# Altium project QCM_hardware_V2.PrjPcb
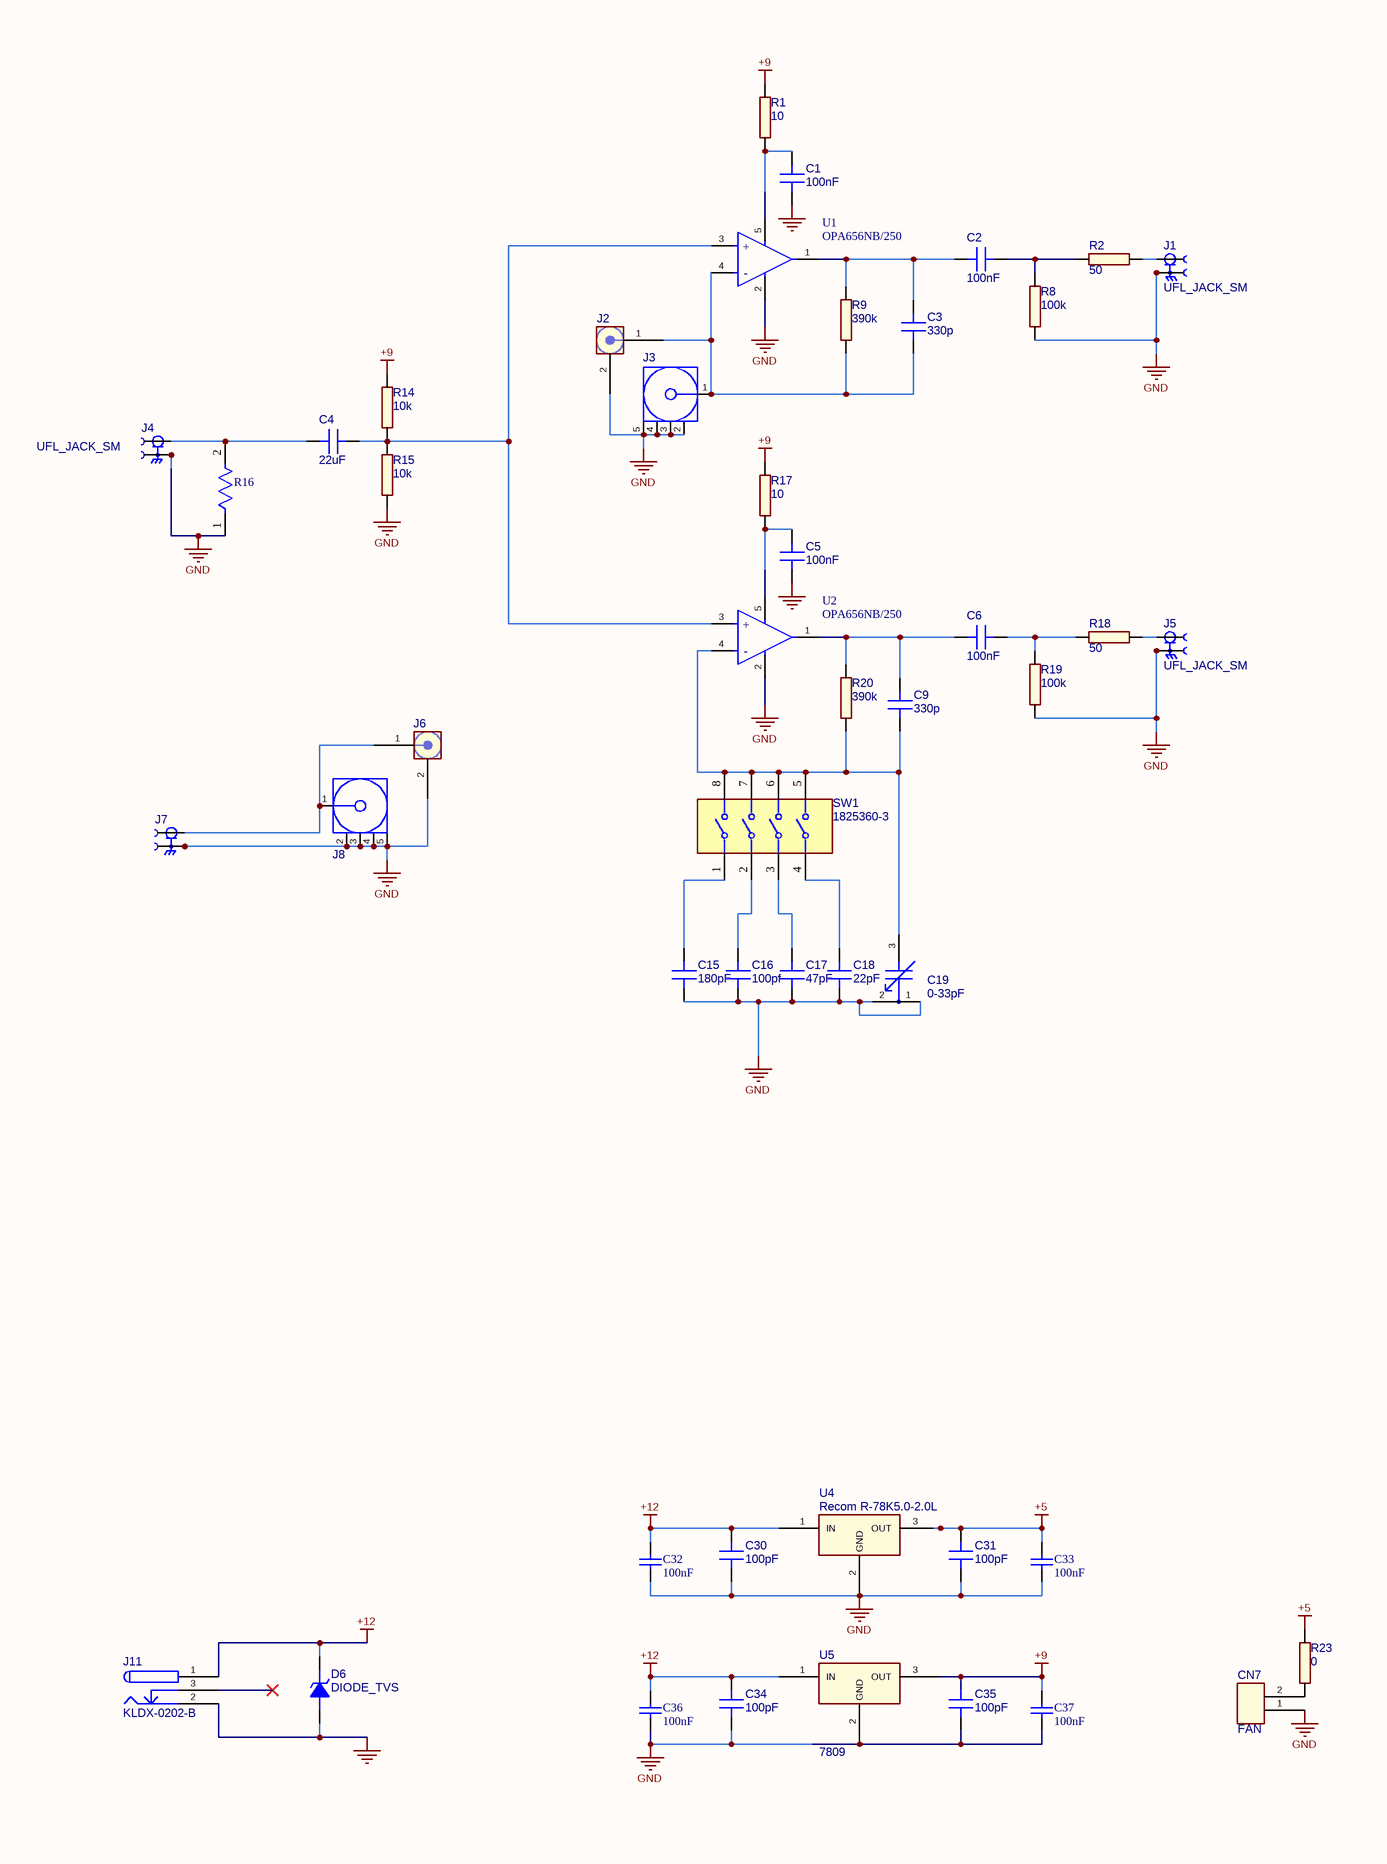
[diagram p0: QCM_hardware_V2.SchDoc, left]
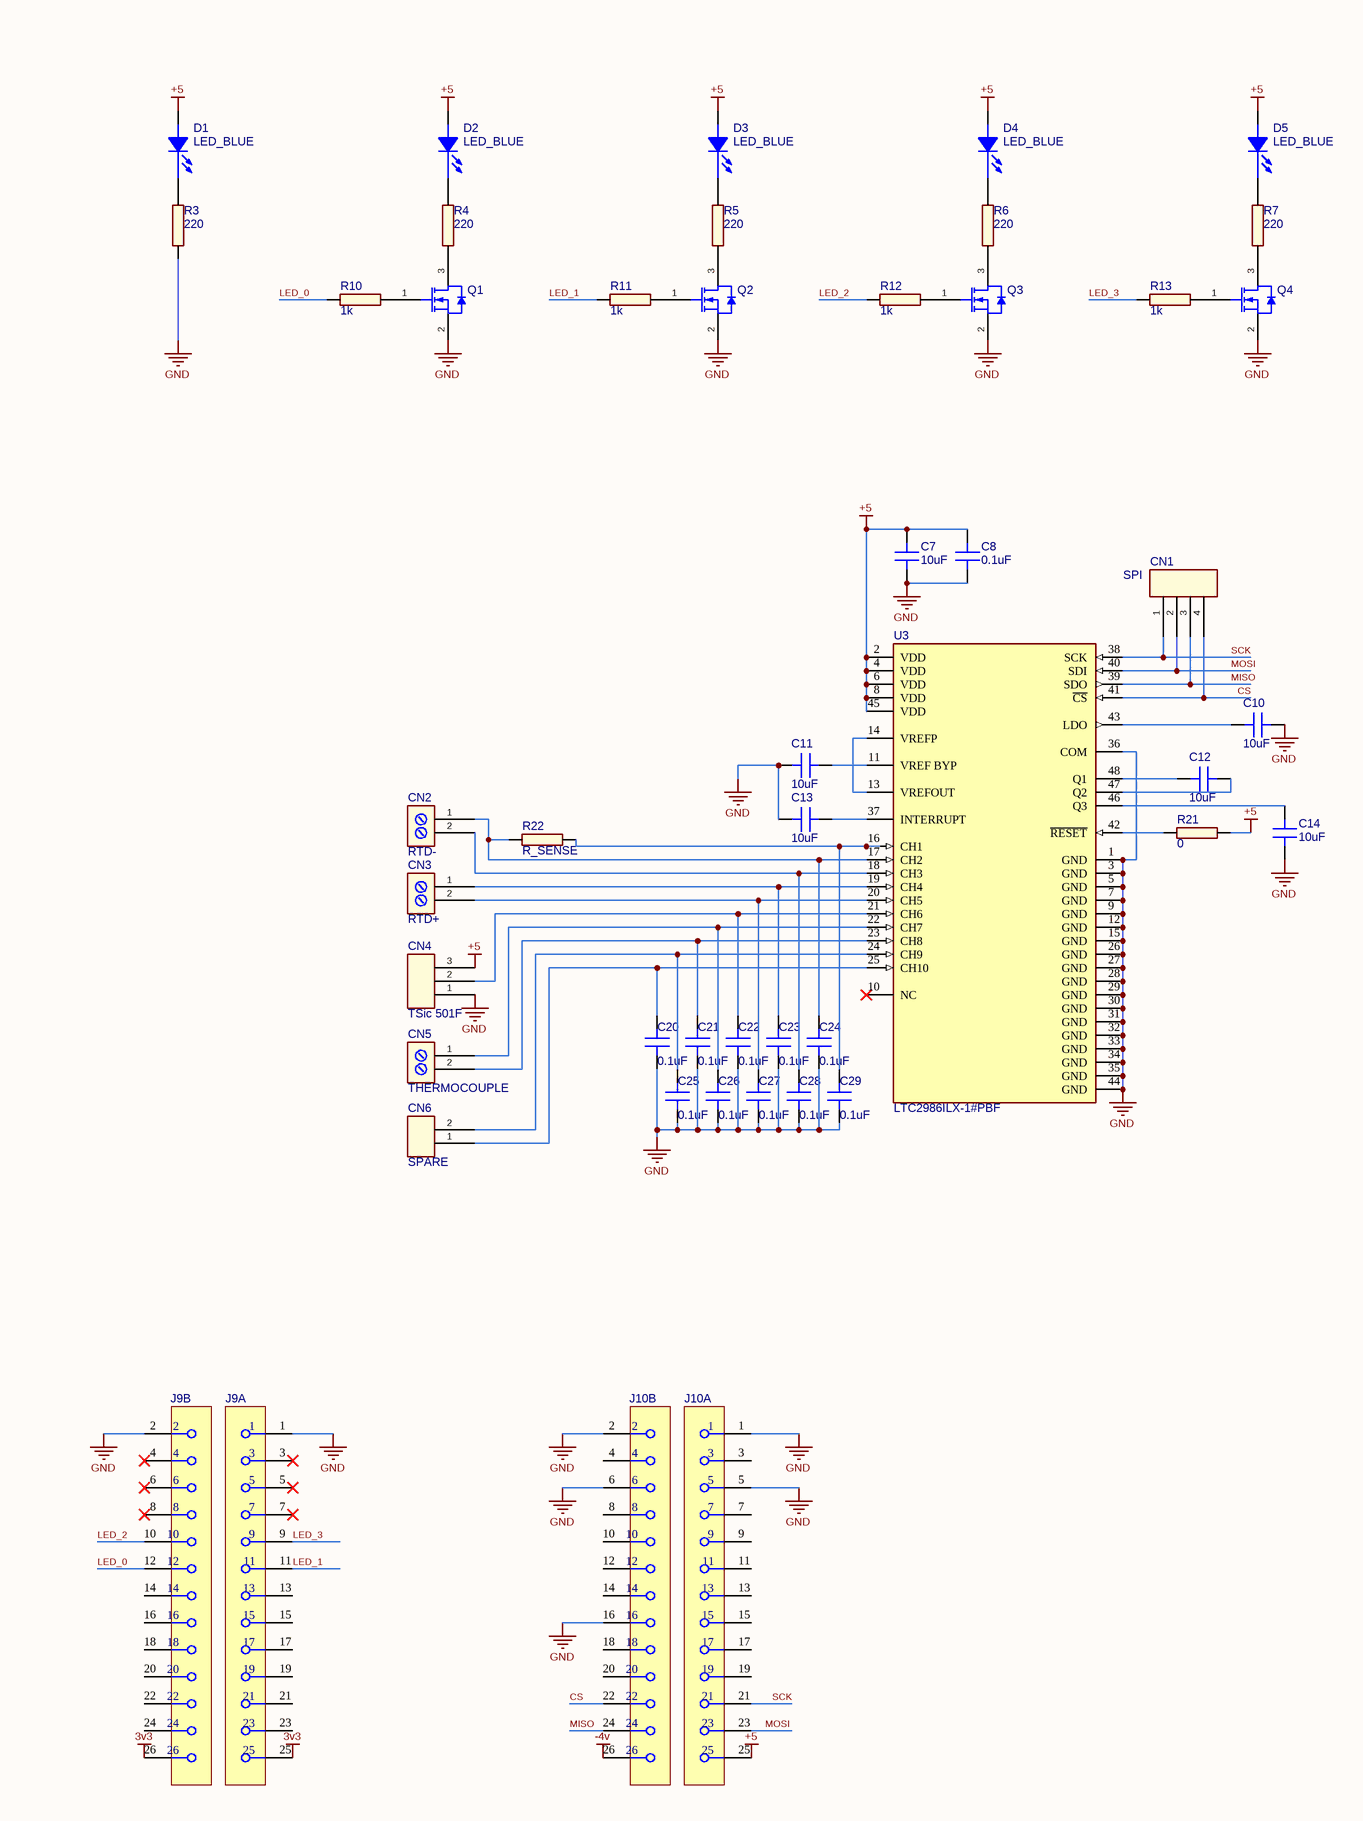
[diagram p1: QCM_hardware_V2.SchDoc, right]
1 sheet, 95 parts. Net scope: global (net labels, ports and power ports of the same name join across sheets).
Board file: QCM_hardware_V2.PcbDoc

## Sheet QCM_hardware_V2.SchDoc
size A2; SheetNumber: 1; SheetTotal: 1

### Parts
?  (no value)  (graphical)
C1  100nF  [C_0805]
C2  100nF  [C_0805]
C3  330p  [C_0805]
C4  22uF  [C_0805]
C5  100nF  [C_0805]
C6  100nF  [C_0805]
C7  10uF  [C_0805]
C8  0.1uF  [C_0805]
C9  330p  [C_0805]
C10  10uF  [C_0805]
C11  10uF  [C_0805]
C12  10uF  [C_0805]
C13  10uF  [C_0805]
C14  10uF  [C_0805]
C15  180pF  [C_0805]
C16  100pf  [C_0805]
C17  47pF  [C_0805]
C18  22pF  [C_0805]
C19  0-33pF  [FP-BFC280832659-MFG]
C20  0.1uF  [C_0805]
C21  0.1uF  [C_0805]
C22  0.1uF  [C_0805]
C23  0.1uF  [C_0805]
C24  0.1uF  [C_0805]
C25  0.1uF  [C_0805]
C26  0.1uF  [C_0805]
C27  0.1uF  [C_0805]
C28  0.1uF  [C_0805]
C29  0.1uF  [C_0805]
C30  100pF  [C_0805]
C31  100pF  [C_0805]
C32  100nF  [CAPC1206(3216)170_N]
C33  100nF  [CAPC1206(3216)170_N]
C34  100pF  [C_0805]
C35  100pF  [C_0805]
C36  100nF  [CAPC1206(3216)170_N]
C37  100nF  [CAPC1206(3216)170_N]
CN1  SPI  [HDR4]
CN2  RTD-  [TERMINAL_BLOCK2]
CN3  RTD+  [TERMINAL_BLOCK2]
CN4  TSic 501F  [HDR3]
CN5  THERMOCOUPLE  [TERMINAL_BLOCK2]
CN6  SPARE  [HDR2]
CN7  FAN  [HDR2]
D1  LED_BLUE  [LED_3MM_BLUE]
D2  LED_BLUE  [LED_3MM_BLUE]
D3  LED_BLUE  [LED_3MM_BLUE]
D4  LED_BLUE  [LED_3MM_BLUE]
D5  LED_BLUE  [LED_3MM_BLUE]
D6  DIODE_TVS  [DIODE_SMA]
J1  UFL_JACK_SM  [UFL_JACK_SM]
J2  BNC_ELBOW2  [BNC_ELBOW2]  (value not drawn)
J3  60711002241505  [60711002241505]  (value not drawn)
J4  UFL_JACK_SM  [UFL_JACK_SM]
J5  UFL_JACK_SM  [UFL_JACK_SM]
J6  BNC_ELBOW2  [BNC_ELBOW2]  (value not drawn)
J7  UFL_JACK_SM  [UFL_JACK_SM]  (value not drawn)
J8  60711002241505  [60711002241505]  (value not drawn)
J9  SFH11-PBPC-D13-ST-BK  [SFH11-PBPC-D13-ST-BK_MFG]  (value not drawn)  (parts A,B of 2)
J10  SFH11-PBPC-D13-ST-BK  [SFH11-PBPC-D13-ST-BK_MFG]  (value not drawn)  (parts A,B of 2)
J11  KLDX-0202-B  [KYCN-KLDX-0202-B_V]
Q1  2N7002K  [ONSC-SOT-23-3-318-08_V]  (value not drawn)
Q2  2N7002K  [ONSC-SOT-23-3-318-08_V]  (value not drawn)
Q3  2N7002K  [ONSC-SOT-23-3-318-08_V]  (value not drawn)
Q4  2N7002K  [ONSC-SOT-23-3-318-08_V]  (value not drawn)
R1  10  [R_0805]
R2  50  [R_0805]
R3  220  [R_0805]
R4  220  [R_0805]
R5  220  [R_0805]
R6  220  [R_0805]
R7  220  [R_0805]
R8  100k  [R_0805]
R9  390k  [R_0805]
R10  1k  [R_0805]
R11  1k  [R_0805]
R12  1k  [R_0805]
R13  1k  [R_0805]
R14  10k  [R_0805]
R15  10k  [R_0805]
R16  CRCW080550R0FKTA  [FP-D12-CRCW0805-MFG]  (value not drawn)
R17  10  [R_0805]
R18  50  [R_0805]
R19  100k  [R_0805]
R20  390k  [R_0805]
R21  0  [R_0805]
R22  R_SENSE  [R_AXIAL_9.0x3.2mm_p12.7mm]
R23  0  [R_0805]
SW1  1825360-3  [FP-1825360-3-MFG]
U1  OPA656NB/250  [FP-DBV0005A-IPC_A]
U2  OPA656NB/250  [FP-DBV0005A-IPC_A]
U3  LTC2986ILX-1#PBF  [FP-LX-48-05-08-1760-MFG]
U4  Recom R-78K5.0-2.0L  [TO220H]
U5  7809  [TO220H]

### Nets
3v3: J9.25 J9.26
+5: C7.1 C8.1 C31.2 C33.2 CN4.3 D1.A(ANODE) D2.A(ANODE) D3.A(ANODE) D4.A(ANODE) D5.A(ANODE) J10.25 R21.1 R23.2 U3.2(VDD) U3.4(VDD) U3.6(VDD) U3.8(VDD) U3.45(VDD) U4.3(OUT)
+9: C35.2 C37.2 R1.1 R14.1 R17.1 U5.3(OUT)
+12: C30.2 C32.2 C34.2 C36.2 D6.C(CATHODE) J11.1 U4.1(IN) U5.1(IN)
-4v: J10.26
GND: C1.2 C5.2 C7.2 C8.2 C10.2 C11.1 C13.1 C14.2 C15.2 C16.2 C17.2 C18.2 C19.1(R) C19.2(R) C20.2 C21.2 C22.2 C23.2 C24.2 C25.2 C26.2 C27.2 C28.2 C29.2 C30.1 C31.1 C32.1 C33.1 C34.1 C35.1 C36.1 C37.1 CN4.1 CN7.1 D6.A(ANODE) J1.2 J1.3 J2.2(SHIELD) J3.2(GND) J3.3(GND) J3.4(GND) J3.5(GND) J4.2 J4.3 J5.2 J5.3 J6.2(SHIELD) J7.2 J7.3 J8.2(GND) J8.3(GND) J8.4(GND) J8.5(GND) J9.1 J9.2 J10.1 J10.2 J10.5 J10.6 J10.16 J11.2 Q1.2(S) Q2.2(S) Q3.2(S) Q4.2(S) R3.2 R8.2 R15.2 R16.1 R19.2 U1.2(-VS) U2.2(-VS) U3.1(GND) U3.3(GND) U3.5(GND) U3.7(GND) U3.9(GND) U3.12(GND) U3.15(GND) U3.26(GND) U3.27(GND) U3.28(GND) U3.29(GND) U3.30(GND) U3.31(GND) U3.32(GND) U3.33(GND) U3.34(GND) U3.35(GND) U3.36(COM) U3.44(GND) U4.2(GND) U5.2(GND)
CS: CN1.4 J10.22 U3.41(~{CS})
LED_0: J9.12 R10.1
LED_1: J9.11 R11.1
LED_2: J9.10 R12.1
LED_3: J9.9 R13.1
MISO: CN1.3 J10.24 U3.39(SDO)
MOSI: CN1.2 J10.23 U3.40(SDI)
SCK: CN1.1 J10.21 U3.38(SCK)
NetC1_1: C1.1 R1.2 U1.5(+VS)
NetC2_1: C2.1 C3.1 R9.2 U1.1(VOUT)
NetC2_2: C2.2 R2.1 R8.1
NetC3_2: C3.2 J2.1(CENTER) J3.1(Signal) R9.1 U1.4(VIN-)
NetC4_1: C4.1 J4.1 R16.2
NetC4_2: C4.2 R14.2 R15.1 U1.3(VIN+) U2.3(VIN+)
NetC5_1: C5.1 R17.2 U2.5(+VS)
NetC6_1: C6.1 C9.1 R20.2 U2.1(VOUT)
NetC6_2: C6.2 R18.1 R19.1
NetC9_2: C9.2 C19.3(S) R20.1 SW1.5 SW1.6 SW1.7 SW1.8 U2.4(VIN-)
NetC10_1: C10.1 U3.43(LDO)
NetC11_2: C11.2 U3.11(VREF_BYP)
NetC12_1: C12.1 U3.48(Q1)
NetC12_2: C12.2 U3.47(Q2)
NetC13_2: C13.2 U3.37(INTERRUPT)
NetC14_1: C14.1 U3.46(Q3)
NetC15_1: C15.1 SW1.1
NetC16_1: C16.1 SW1.2
NetC17_1: C17.1 SW1.3
NetC18_1: C18.1 SW1.4
NetC20_1: C20.1 CN6.1 U3.25(CH10)
NetC21_1: C21.1 CN5.2 U3.23(CH8)
NetC22_1: C22.1 CN4.2 U3.21(CH6)
NetC23_1: C23.1 CN3.1 U3.19(CH4)
NetC24_1: C24.1 CN2.1 R22.1 U3.17(CH2)
NetC25_1: C25.1 CN6.2 U3.24(CH9)
NetC26_1: C26.1 CN5.1 U3.22(CH7)
NetC27_1: C27.1 CN3.2 U3.20(CH5)
NetC28_1: C28.1 CN2.2 U3.18(CH3)
NetC29_1: C29.1 R22.2 U3.16(CH1)
NetCN7_2: CN7.2 R23.1
NetD1_C: D1.C(CATHODE) R3.1
NetD2_C: D2.C(CATHODE) R4.1
NetD3_C: D3.C(CATHODE) R5.1
NetD4_C: D4.C(CATHODE) R6.1
NetD5_C: D5.C(CATHODE) R7.1
NetJ1_1: J1.1 R2.2
NetJ5_1: J5.1 R18.2
NetJ6_1: J6.1(CENTER) J7.1 J8.1(Signal)
NetQ1_1: Q1.1(G) R10.2
NetQ1_3: Q1.3(D) R4.2
NetQ2_1: Q2.1(G) R11.2
NetQ2_3: Q2.3(D) R5.2
NetQ3_1: Q3.1(G) R12.2
NetQ3_3: Q3.3(D) R6.2
NetQ4_1: Q4.1(G) R13.2
NetQ4_3: Q4.3(D) R7.2
NetR21_2: R21.2 U3.42(~{RESET})
NetU3_13: U3.13(VREFOUT) U3.14(VREFP)

Not connected (* = marked no-connect by the designer): J9 3* 4* 5* 6* 7* 8* 13 14 15 16 17 18 19 20 21 22 23 24; J10 3 4 7 8 9 10 11 12 13 14 15 17 18 19 20; J11 3*; U3 10(NC)*

### Notes on the sheet
- Date:
- ELD/LION, Leiden University
- File:
- Engineer:
- Sheet:
- of
- Revision:
- (in symbol CMP-0018-00414-3) +; -

### Library data of the parts
? = TitleBlock-ELD
C1-C18 C20-C31 C34 C35 = C_0805
C19 = CMP-02422-000001-1: CAP TRIMMER 5.5-65PF 150V TH; Manufacturer: Vishay BC Components; Manufacturer Part Number: BFC280832659; Temperature Coefficient: +300/-700ppm/°C; Material: Polypropylene; Category: Cap; Voltage Rating: 150V; Octopart: https://octopart.com/bfc280832659-vishay-41937824; Device Class L2: Capacitors; Device Class L1: Passive Components; Value: 5.5-65pF; Temperature Range Low: -40°C; Capacitance: 5.5-65pF; ComponentLink2URL: https://www.vishay.com/docs/28528/bfc2808-10mm.pdf; Temperature: -40°C to +70°C; ComponentLink2Description: Datasheet; Temperature Range High: +70°C; Device Class L3: Trimmer / Variable Capacitors; RoHS: TRUE; Lead Free: Yes; Digikey Description: CAP TRIMMER 5.5-65PF 150V TH; Automotive: No; Package: BFC280832659; Mouser Description: Trimmer / Variable Capacitors TRIMMER CAPACITOR; Height: 11mm
C32 C33 C36 C37 = CMP-1037-04098-1: CAP 68nF 100V ±5% 1206 (3216 Metric) Thickness 1.7mm SMD; Case-Metric: 3216; Case-EIA: 1206; Tolerance: Â±5%; Technology: SMT; Value: 68nF; Max Thickness: 1.7 mm; Rated Voltage: 100 V
CN1 = HDR4
CN2 CN3 CN5 = TERMINAL_BLOCK2
CN4 = HDR3
CN6 CN7 = HDR2
J1 J4 J5 J7 = UFL_JACK_SM: U.FL (UMCC) Connector Jack, Male Pin 50Ohm Surface Mount Solder; MP: CONUFL001-SMD-T; MF: Linx; Price: None; Package: None; Value: *; Check_prices: https://www.snapeda.com/parts/CONUFL001-SMD-T/Linx/view-part/?ref=eda; Availability: Unavailable; SnapEDA_Link: https://www.snapeda.com/parts/CONUFL001-SMD-T/Linx/view-part/?ref=snap
J3 J8 = CMP-03913-162524349-1: Rf Conn, Bnc, R/a Jack, 50 Ohm, Tht Rohs Compliant: Yes
J9 J10 = CMP-00595-18674420-1: Conn Socket Strip F 26 POS 2.54mm Solder ST Thru-Hole; Current Rating: 3A; Number of Positions: 26; Connector Type: Header, Socket; Contact Resistance: 20mΩ; Insulation Resistance: 1GΩ; Min Operating Temperature: -40°C; Lead Free: Lead Free; Contact Plating: Gold; HelpURL: https://drawings-pdf.s3.amazonaws.com/11160.pdf; Termination: Solder; Max Operating Temperature: 105°C; ComponentLink2Description: Datasheet URL; Pitch: 2.54mm; RoHS: Compliant; Number of Pins: 26; Mount: Through Hole; Terminal Pitch: 2.54mm; Row Spacing: 2.54mm; Number of Rows: 2; ComponentLink2URL: https://drawings-pdf.s3.amazonaws.com/11160.pdf; REACH SVHC: Yes; Introduction Date: 2011-09-15; Contact Gender: Female; Lifecycle Status: Production; Color: Black
J11 = CMP-0256-00001-1: 3 Conductor Power Jack, 2 break 2 aux contacts; ComponentLink2URL: http://anacapa.kycon.com/Catalog_PDF/KLDX_0202.pdf; PackageReference: KLDX-0202-B; Contact Finish: Brass; ComponentLink2Description: Datasheet; Mounting Technology: Through Hole; PackageDescription: Jack, 9 x 14.5 mm Body, 2.5 mm Center Pin Diameter; ComponentLink1Description: Manufacturer URL; PartNumber: KLDX-0202-B; ComponentLink1URL: http://kycon.com/
Q1-Q4 = CMP-1058-00778-1: N-Channel TrenchFET Power MOSFET, 300 mA, 60 V Enhancement, 3-Pin SOT-23 2N7002K-T1-GE3; PartNumber: MGSF1N03LT1G; Manufacturer: On Semiconductor; VGS(th) Max (V): 2.4; Channel Polarity: N Channel; Ciss Typ (pF): 140; Packing: Tape and Reel; Crss Typ (pF): 40; Coss Typ (pF): 100; Configuration: Single; V(BR)DSS Min (V): 30; ID Max (A): 2.1; VGS Max (V): 20; ComponentLink1Description: Manufacturer URL; DatasheetVersion: Rev. 10; ComponentLink1URL: http://www.onsemi.com/; Mounting Technology: Surface Mount; PackageVersion: Rev. AP, 11/2009; PackageDescription: 3-Pin Small Outline Transistor, Body 2.92 x 1.3 mm, Pitch 0.95 mm; Package Type: SOT-23-3; ComponentLink3URL: http://www.onsemi.cn/pub_link/Collateral/318-08.PDF; RoHS: Pb-Free; ComponentLink3Description: Package Specification; ComponentLink2Description: Datasheet; PackageReference: SOT-23-3-318-08; ComponentLink2URL: http://www.onsemi.cn/pub_link/Collateral/MGSF1N03LT1-D.PDF
R1-R15 R17-R21 R23 = R_0805
R16 = CMP-00030-21390498-1: CRCW080550R0FKTA Res Thick Film 0805 50 Ohm 1% 0.125W(1/8W) ±100ppm/C Pad SMD Automotive T/R; Temperature Coefficient: 100ppm/°C; Resistance: 50Ω; Voltage Rating: 150V; Power Rating: 125mW; Length: 2mm; Case Code (Imperial): 0805; Height: 450µm; Contact Plating: Lead, Tin; Width: 1.25mm; Max Operating Temperature: 155°C; NexarPartId: 21390498; Case Code (Metric): 2012; Min Operating Temperature: -55°C; Tolerance: 1%; Case/Package: 0805; Lead Free: Contains Lead; RoHS: Non-Compliant; Composition: Thick Film; Weight: 5.499807mg
R22 = R_1W: Throughhole resistor with a 12.7mm pitch (Standard 1W metalfilm/carbon)
SW1 = CMP-03400-000022-1: SWITCH SLIDE DIP SPST 100MA 24V; Washable: Yes; Contact Current Rating: 1A; Electrical Life: 1000Cycles; Number of Circuits: 4; Pitch: 0.1inch; Actuator Length: 0.99mm; Contact Resistance: 50mR; Actuator Type: Standard; Contact Post Length: 4mm; Voltage Rating (DC): 5V; Actuator Material: Polybutylene; Sealable: No (Without); Max Voltage Rating (DC): 24V; Throw Configuration: SPST; Mount: Through Hole; Type: Switch; RoHS Compliant: Yes; Min Operating Temperature: -30°C; Max Operating Temperature: 85°C; Orientation: Straight; Packaging: Rail/Tube; Series: ADE; Lead Free: Lead Free; Depth: 7.49mm; Flammability Rating: UL94 V-0; Radiation Hardening: No; Terminal Pitch: 2.54mm; Package Quantity: 35; Contact Material: Copper Alloy; Housing Color: Black; Number of Positions: 4; Length: 0.476inch; ELV: Compliant; Termination: PC Pins; Housing Material: Polyphenylene; Contact Plating: Gold; Max Current Rating: 100mA; Height: 0.138inch
U1 U2 = CMP-0018-00414-3: IC OPAMP VFB 1 CIRCUIT SOT23-5; Number of Elements: 1; Max Dual Supply Voltage: 6V; Input Bias Current: 20pA; Slew Rate: 290V/µs; Power Supply Rejection Ratio (PSRR): 74dB; Common Mode Rejection Ratio: 88dB; Operating Supply Voltage: 12V; Settling Time: 16ns; Dual Supply Voltage: 5V; Unity Gain Bandwidth Product: 230MHz; Nominal Supply Current: 16mA; Min Supply Voltage: 10V; Input Offset Voltage (Vos): 600uV; Packaging: Tape and Reel; Lead Free: Lead Free; Max Operating Temperature: 85°C; Width: 1.6mm; Min Operating Temperature: -40°C; Number of Circuits: 1; Package Quantity: 250; Number of Pins: 5; Case/Package: SOT-23; Height: 1.15mm; Max Supply Voltage: 12V; Number of Channels: 1; Length: 2.9mm; Number of Amplifiers: 1; Max I/O Voltage: 600uV; Bandwidth: 230MHz; REACH SVHC: No SVHC; Radiation Hardening: No; Gain Bandwidth Product: 230MHz
U3 = CMP-09131-000069-1: IC SENSOR TEMP MEASUREMNT 48LQFP; Max Supply Voltage: 5.25V; Min Supply Voltage: 2.85V; Number of Pins: 48; RoHS Compliant: Yes; REACH SVHC: No SVHC; Case/Package: LQFP; Min Operating Temperature: -40°C; Supplier 1: Farnell; Supplier Part Number 1: TSIC 501F TO92
U4 U5 = 7809: Standard +9V 1A positive fixed voltage regulator in TO-220 housing; Manufacturer 1: STMicroelectronics; Manufacturer Part Number 1: L7809CV; Description 1: STMICROELECTRONICS - L7809CV - IC, V REG +9.0V, 7809, TO-220-3; Max Input Voltage: 35V; Min Input Voltage: 11V; Output Type: Fixed,Adjustable; Number of Outputs: 1; Output Voltage: 9V; Dropout Voltage: 2V; Output Current: 1.5A; Quiescent Current: 8mA; Power Supply Rejection Ratio (PSRR): 55dB; Accuracy: 2%; Tolerance: 5%; ComponentLink1URL: http://www.jameco.com/Jameco/Products/ProdDS/902071.pdf; ComponentLink1Description: http://www.jameco.com/Jameco/Products/ProdDS/902071.pdf; ComponentLink2URL: http://www.ti.com/lit/ds/symlink/lm7805c.pdf; ComponentLink2Description: http://www.ti.com/lit/ds/symlink/lm7805c.pdf; ComponentLink3URL: http://www.ti.com/general/docs/lit/getliterature.tsp?genericPartNumber=LM7815C&&fileType=pdf; ComponentLink3Description: http://www.ti.com/general/docs/lit/getliterature.tsp?genericPartNumber=LM7815C&&fileType=pdf; Supplier 1: Mouser; Supplier Part Number 1: 511-L7809CV; Stock 1: 8768; Pricing: 1=0.45, 10=0.374, 50=0.374, 100=0.228, 1000=0.176, 2000=0.15, 10000=0.14, 25000=0.133, 50000=0.13, 100000=0.125 (USD); RoHS: Yes; Mount: Through Hole; Case/Package: TO; Number of Pins: 3; Weight: 0.01lb; Min Operating Temperature: 0°C; Max Operating Temperature: 125°C; Packaging: Rail/Tube; Package Quantity: 50; Polarity: Positive; Min Output Voltage: 9V; Max Output Current: 1.5A; Number of Regulators: 1; Nominal Output Voltage: 9V; Output Configuration: Positive; Length: 10.4mm; Height: 14.9mm; Width: 4.6mm; Radiation Hardening: No; REACH SVHC: No SVHC; Lead Free: Lead Free; ComponentLink4URL: https://datasheet.ciiva.com/27055/1991694-27055797.pdf?src-supplier=Jameco; ComponentLink4Description: https://datasheet.ciiva.com/27055/1991694-27055797.pdf?src-supplier=Jameco; ComponentLink5URL: https://datasheet.ciiva.com/26331/179191-da-01-en-spannungsregler-l7809cv-to-220-stm-26331022.pdf?src-supplier=Conrad; ComponentLink5Description: https://datasheet.ciiva.com/26331/179191-da-01-en-spannungsregler-l7809cv-to-220-stm-26331022.pdf?src-supplier=Conrad; ComponentLink6URL: https://datasheet.ciiva.com/1511/1805459-1511921.pdf?src-supplier=Element14; ComponentLink6Description: https://datasheet.ciiva.com/1511/1805459-1511921.pdf?src-supplier=Element14; ComponentLink7URL: https://datasheet.ciiva.com/2044/cd00000444-2044161.pdf?src-supplier=Digi-Key; ComponentLink7Description: https://datasheet.ciiva.com/2044/cd00000444-2044161.pdf?src-supplier=Digi-Key; ComponentLink8URL: https://datasheet.ciiva.com/16393/cd00000444-16393733.pdf?src-supplier=Future+Electronics; ComponentLink8Description: https://datasheet.ciiva.com/16393/cd00000444-16393733.pdf?src-supplier=Future+Electronics; ComponentLink9URL: https://datasheet.ciiva.com/3224/cd00000444-3224953.pdf?src-supplier=Avnet; ComponentLink9Description: https://datasheet.ciiva.com/3224/cd00000444-3224953.pdf?src-supplier=Avnet; ComponentLink10URL: https://datasheet.ciiva.com/18404/70013895-18404043.pdf?src-supplier=Allied+Electronics; ComponentLink10Description: https://datasheet.ciiva.com/18404/70013895-18404043.pdf?src-supplier=Allied+Electronics

## Assembly variants
low_profile_BNC: not fitted J3 J8
high_profile_BNC: not fitted J2 J6